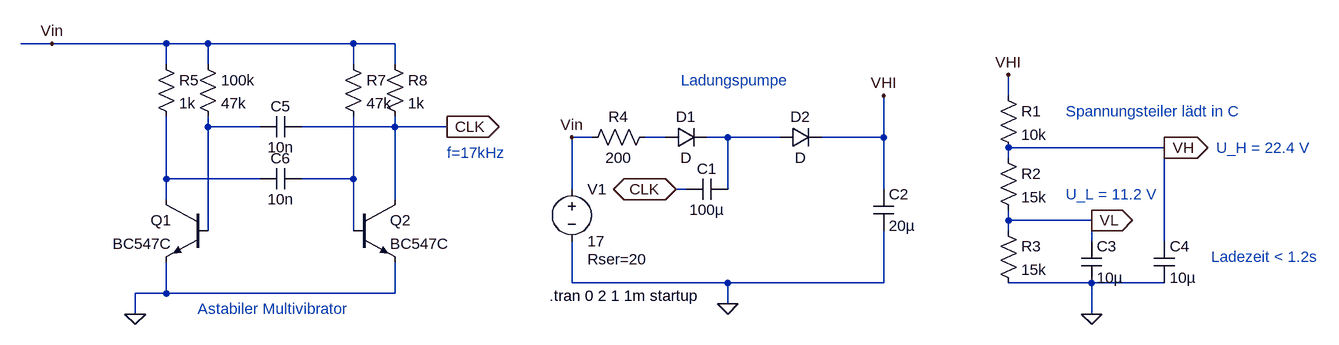
[diagram p0: schematic VoltageDoubler2.asc]
VoltageDoubler2.asc, the LTspice schematic file:
Version 4
SHEET 1 1188 820
WIRE -768 -80 -816 -80
WIRE -592 -80 -768 -80
WIRE -528 -80 -592 -80
WIRE -304 -80 -528 -80
WIRE -240 -80 -304 -80
WIRE -592 -48 -592 -80
WIRE -528 -48 -528 -80
WIRE -304 -48 -304 -80
WIRE -240 -48 -240 -80
WIRE 704 0 704 -32
WIRE -528 48 -528 32
WIRE -448 48 -528 48
WIRE -240 48 -240 32
WIRE -240 48 -384 48
WIRE -160 48 -240 48
WIRE 64 64 32 64
WIRE 176 64 144 64
WIRE 272 64 240 64
WIRE 352 64 272 64
WIRE 512 64 512 0
WIRE 512 64 416 64
WIRE 944 80 704 80
WIRE 704 96 704 80
WIRE -592 128 -592 32
WIRE -448 128 -592 128
WIRE -304 128 -304 32
WIRE -304 128 -384 128
WIRE 32 144 32 64
WIRE 208 144 192 144
WIRE 272 144 272 64
WIRE 512 144 512 64
WIRE -592 160 -592 128
WIRE -240 160 -240 48
WIRE 704 192 704 176
WIRE 832 192 704 192
WIRE -528 208 -528 48
WIRE -304 208 -304 128
WIRE 704 208 704 192
WIRE 832 224 832 192
WIRE 944 224 944 80
WIRE 32 288 32 224
WIRE 272 288 32 288
WIRE 512 288 512 208
WIRE 512 288 272 288
WIRE 832 288 704 288
WIRE 944 288 832 288
WIRE -592 304 -592 256
WIRE -592 304 -640 304
WIRE -240 304 -240 256
WIRE -240 304 -592 304
WIRE 272 320 272 288
WIRE -640 336 -640 304
WIRE 832 336 832 288
FLAG 272 320 0
FLAG 944 80 VH
IOPIN 944 80 Out
FLAG 832 192 VL
IOPIN 832 192 Out
FLAG 192 144 CLK
IOPIN 192 144 BiDir
FLAG -640 336 0
FLAG -768 -80 Vin
FLAG 32 64 Vin
FLAG -160 48 CLK
IOPIN -160 48 Out
FLAG 512 0 VHI
FLAG 832 336 0
FLAG 704 -32 VHI
SYMBOL voltage 32 128 R0
WINDOW 123 0 0 Left 0
WINDOW 39 24 124 Left 2
SYMATTR InstName V1
SYMATTR Value 17
SYMATTR SpiceLine Rser=20
SYMBOL diode 176 80 R270
WINDOW 0 32 32 VTop 2
WINDOW 3 0 32 VBottom 2
SYMATTR InstName D1
SYMBOL diode 352 80 R270
WINDOW 0 32 32 VTop 2
WINDOW 3 0 32 VBottom 2
SYMATTR InstName D2
SYMBOL cap 272 128 R90
WINDOW 0 0 32 VBottom 2
WINDOW 3 32 32 VTop 2
SYMATTR InstName C1
SYMATTR Value 100µ
SYMBOL cap 496 144 R0
SYMATTR InstName C2
SYMATTR Value 20µ
SYMBOL res 688 -16 R0
SYMATTR InstName R1
SYMATTR Value 10k
SYMBOL res 688 80 R0
SYMATTR InstName R2
SYMATTR Value 15k
SYMBOL res 688 192 R0
SYMATTR InstName R3
SYMATTR Value 15k
SYMBOL cap 816 224 R0
SYMATTR InstName C3
SYMATTR Value 10µ
SYMBOL cap 928 224 R0
SYMATTR InstName C4
SYMATTR Value 10µ
SYMBOL res 160 48 R90
WINDOW 0 0 56 VBottom 2
WINDOW 3 32 56 VTop 2
SYMATTR InstName R4
SYMATTR Value 200
SYMBOL res -608 -64 R0
SYMATTR InstName R5
SYMATTR Value 1k
SYMBOL res -256 -64 R0
SYMATTR InstName R8
SYMATTR Value 1k
SYMBOL npn -528 160 M0
SYMATTR InstName Q1
SYMATTR Value BC547C
SYMBOL npn -304 160 R0
SYMATTR InstName Q2
SYMATTR Value BC547C
SYMBOL res -544 -64 R0
SYMATTR InstName 100k
SYMATTR Value 47k
SYMBOL res -320 -64 R0
SYMATTR InstName R7
SYMATTR Value 47k
SYMBOL cap -384 32 R90
WINDOW 0 0 32 VBottom 2
WINDOW 3 32 32 VTop 2
SYMATTR InstName C5
SYMATTR Value 10n
SYMBOL cap -384 112 R90
WINDOW 0 0 32 VBottom 2
WINDOW 3 32 32 VTop 2
SYMATTR InstName C6
SYMATTR Value 10n
TEXT -2 308 Left 2 !.tran 0 2 1 1m startup
TEXT -544 328 Left 2 ;Astabiler Multivibrator
TEXT 792 24 Left 2 ;Spannungsteiler lädt in C
TEXT 200 -24 Left 2 ;Ladungspumpe
TEXT -160 88 Left 2 ;f=17kHz
TEXT 1024 80 Left 2 ;U_H = 22.4 V
TEXT 792 152 Left 2 ;U_L = 11.2 V
TEXT 1016 248 Left 2 ;Ladezeit < 1.2s

The netlist it stands for:
* VoltageDoubler2.asc
V1 Vin 0 17 Rser=20
D1 N002 N003 D
D2 N003 VHI D
C1 N003 CLK 100µ
C2 VHI 0 20µ
R1 VHI VH 10k
R2 VH VL 15k
R3 VL 0 15k
C3 VL 0 10µ
C4 VH 0 10µ
R4 N002 Vin 200
R5 Vin N004 1k
R8 Vin CLK 1k
Q1 N004 N001 0 0 BC547C
Q2 CLK N005 0 0 BC547C
R§100k Vin N001 47k
R7 Vin N005 47k
C5 CLK N001 10n
C6 N005 N004 10n
.model D D
.lib standard.dio
.model NPN NPN
.model PNP PNP
.lib standard.bjt
.tran 0 2 1 1m startup
* Astabiler Multivibrator
* Spannungsteiler lädt in C
* Ladungspumpe
* f=17kHz
* U_H = 22.4 V
* U_L = 11.2 V
* Ladezeit < 1.2s
.backanno
.end